# Altium schematic sheet 05_SiP_IO.SchDoc
size 812 x 508 mm; SheetNumber: 5; SheetTotal: 16
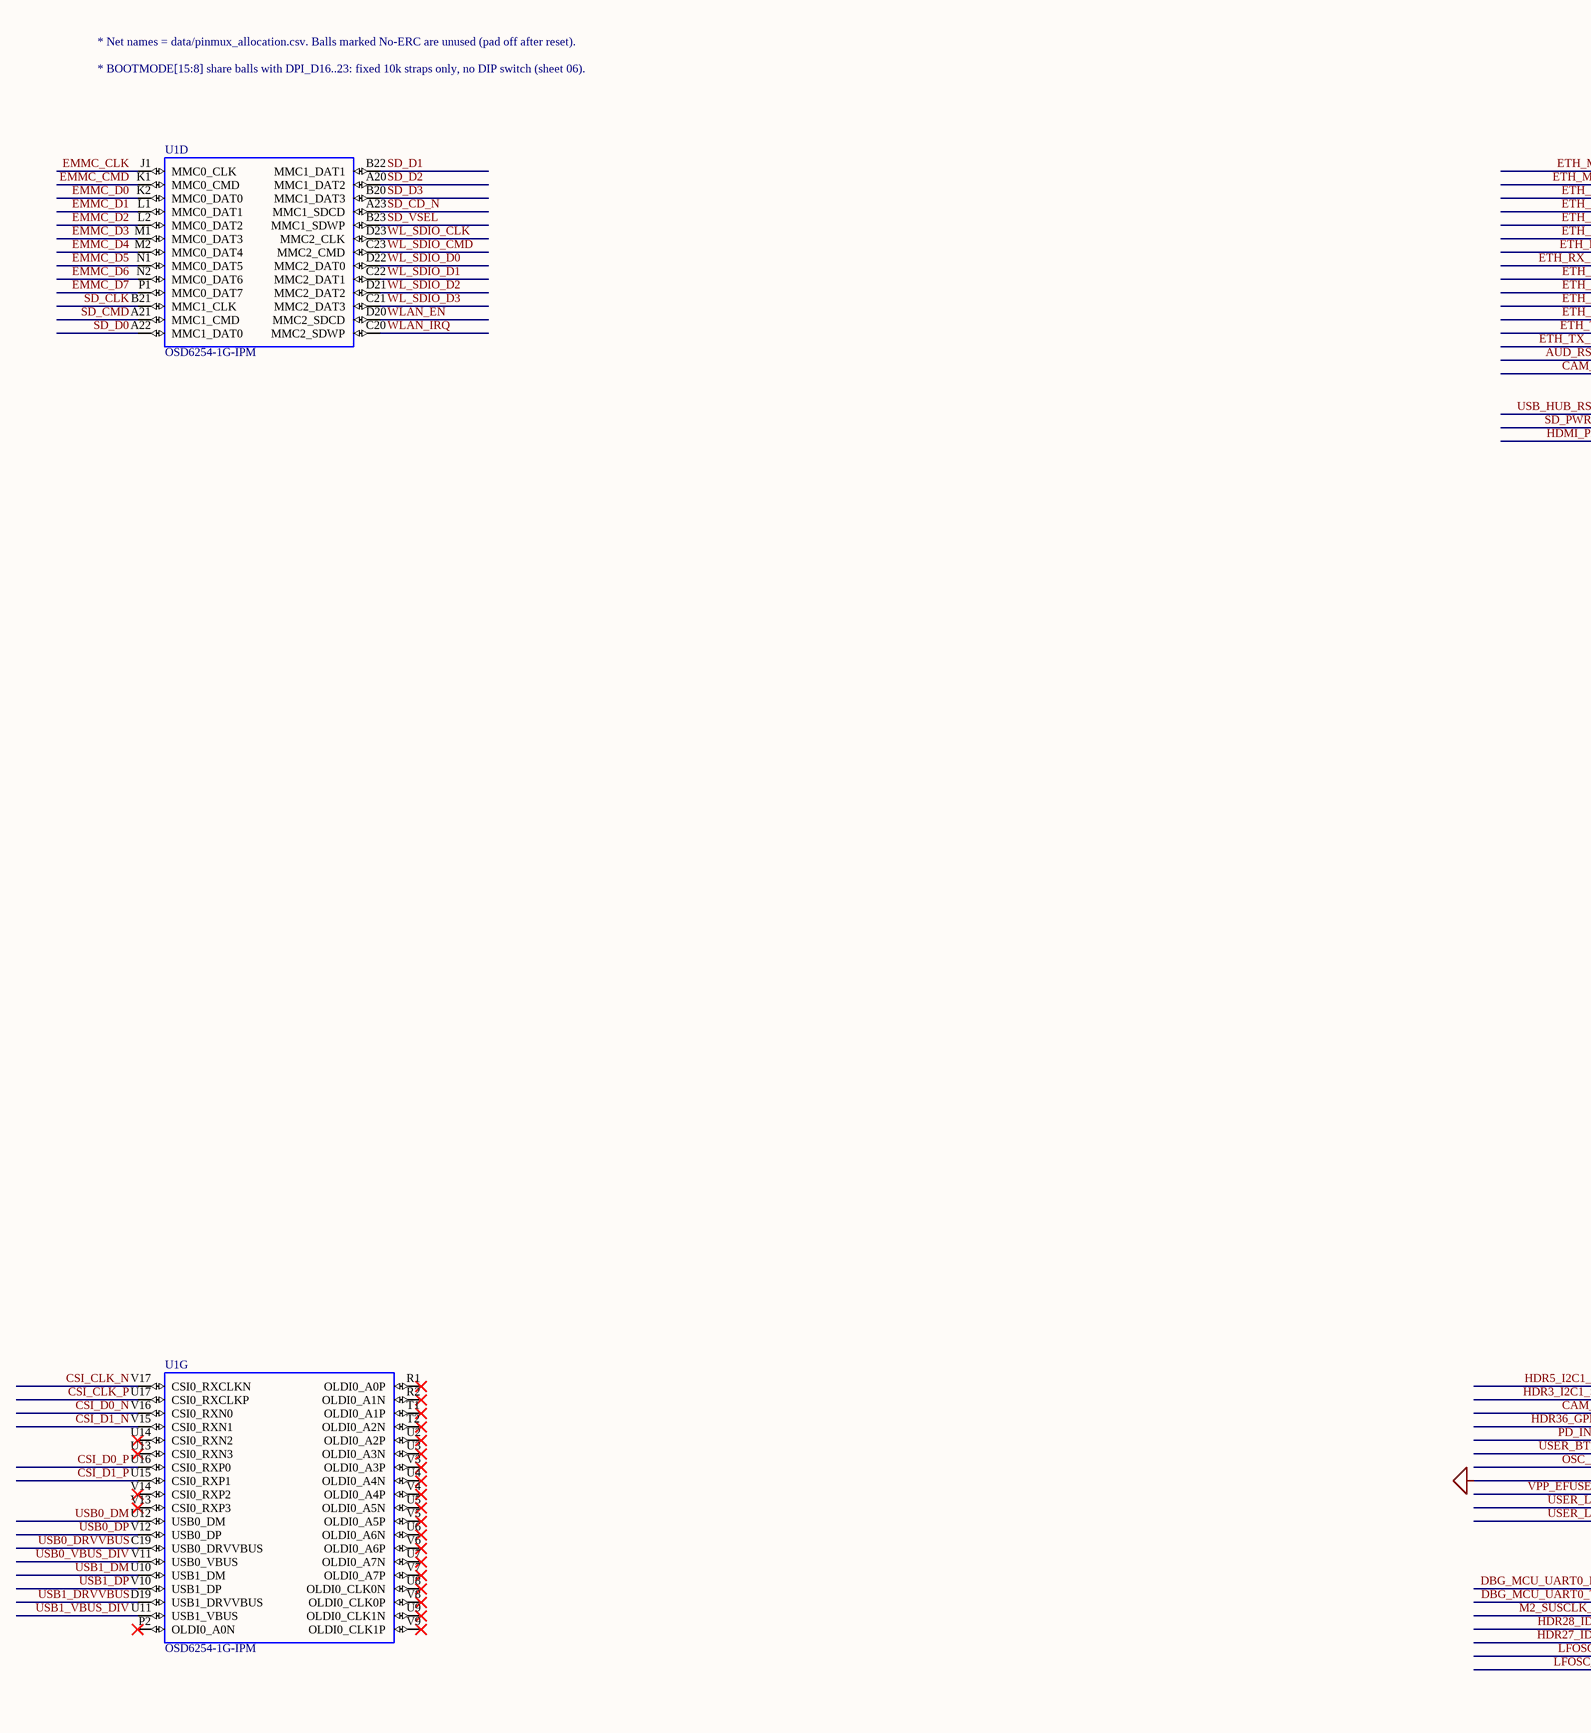
[diagram p0: 05_SiP_IO.SchDoc, left]
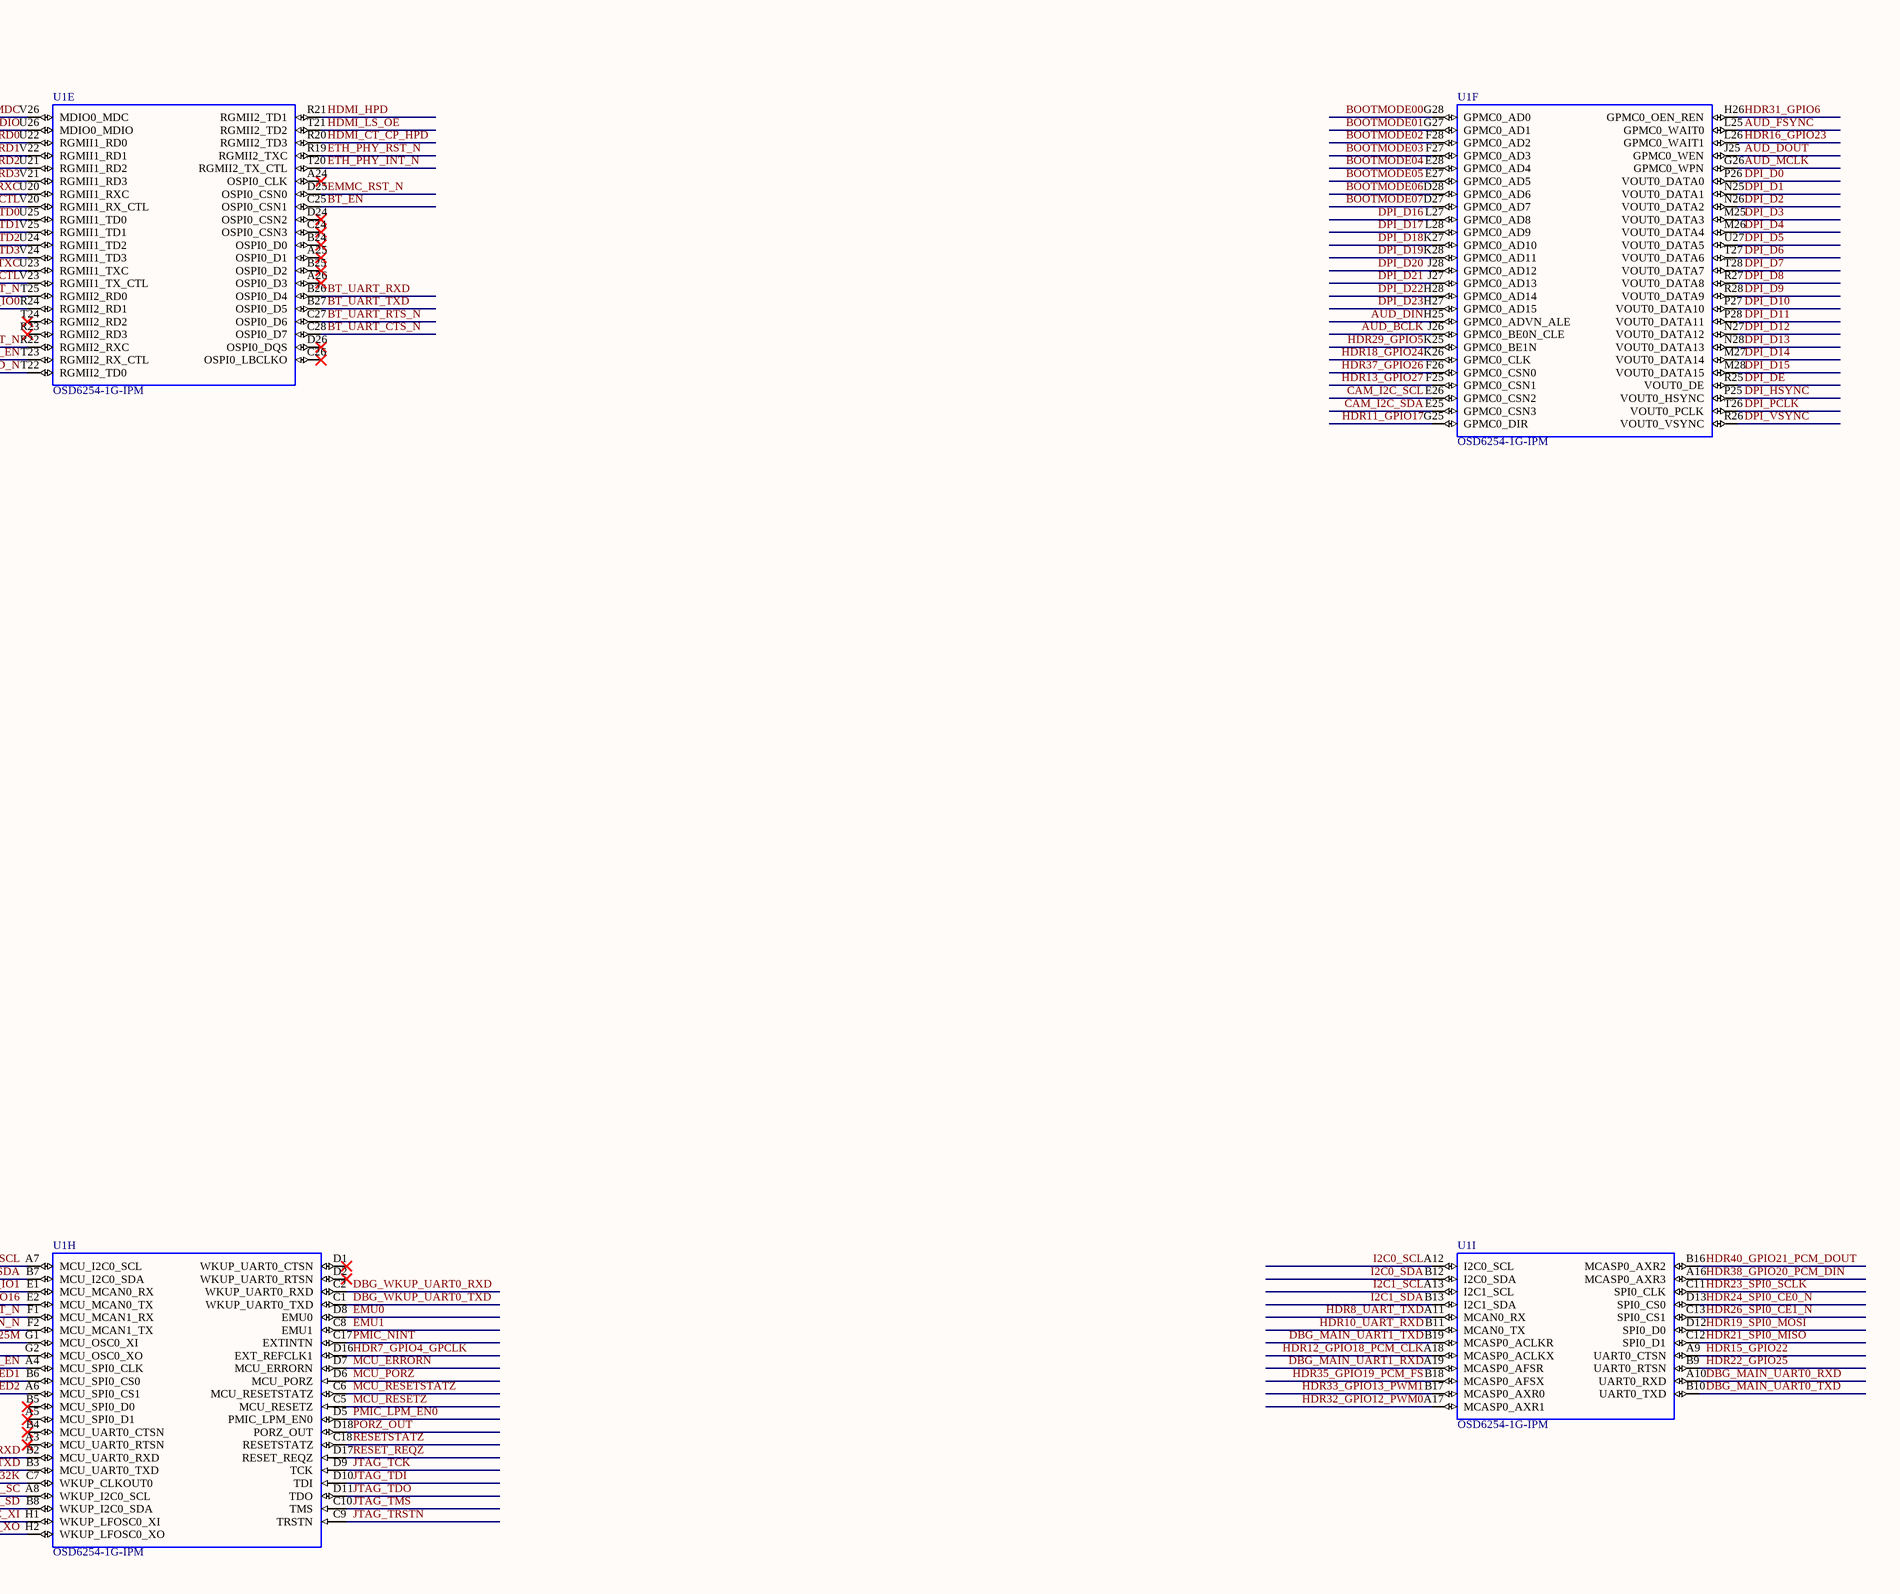
[diagram p1: 05_SiP_IO.SchDoc, right]

## Parts
U1  OSD6254-1G-IPM  [OSD62X-PM_BGA500]  (parts D,E,F,G,H,I of 9)

## Nets
GND: U1.G2(MCU_OSC0_XO)
AUD_BCLK: U1.J26(GPMC0_BE0N_CLE)
AUD_DIN: U1.H25(GPMC0_ADVN_ALE)
AUD_DOUT: U1.J25(GPMC0_WEN)
AUD_FSYNC: U1.L25(GPMC0_WAIT0)
AUD_MCLK: U1.G26(GPMC0_WPN)
AUD_RST_N: U1.T25(RGMII2_RD0)
BOOTMODE00: U1.G28(GPMC0_AD0)
BOOTMODE01: U1.G27(GPMC0_AD1)
BOOTMODE02: U1.F28(GPMC0_AD2)
BOOTMODE03: U1.F27(GPMC0_AD3)
BOOTMODE04: U1.E28(GPMC0_AD4)
BOOTMODE05: U1.E27(GPMC0_AD5)
BOOTMODE06: U1.D28(GPMC0_AD6)
BOOTMODE07: U1.D27(GPMC0_AD7)
BT_EN: U1.C25(OSPI0_CSN1)
BT_UART_CTS_N: U1.C28(OSPI0_D7)
BT_UART_RTS_N: U1.C27(OSPI0_D6)
BT_UART_RXD: U1.B26(OSPI0_D4)
BT_UART_TXD: U1.B27(OSPI0_D5)
CAM_I2C_SCL: U1.E26(GPMC0_CSN2)
CAM_I2C_SDA: U1.E25(GPMC0_CSN3)
CAM_IO0: U1.R24(RGMII2_RD1)
CAM_IO1: U1.E1(MCU_MCAN0_RX)
CSI_CLK_N: U1.V17(CSI0_RXCLKN)
CSI_CLK_P: U1.U17(CSI0_RXCLKP)
CSI_D0_N: U1.V16(CSI0_RXN0)
CSI_D0_P: U1.U16(CSI0_RXP0)
CSI_D1_N: U1.V15(CSI0_RXN1)
CSI_D1_P: U1.U15(CSI0_RXP1)
DBG_MAIN_UART0_RXD: U1.A10(UART0_RXD)
DBG_MAIN_UART0_TXD: U1.B10(UART0_TXD)
DBG_MAIN_UART1_RXD: U1.A19(MCASP0_AFSR)
DBG_MAIN_UART1_TXD: U1.B19(MCASP0_ACLKR)
DBG_MCU_UART0_RXD: U1.B2(MCU_UART0_RXD)
DBG_MCU_UART0_TXD: U1.B3(MCU_UART0_TXD)
DBG_WKUP_UART0_RXD: U1.C2(WKUP_UART0_RXD)
DBG_WKUP_UART0_TXD: U1.C1(WKUP_UART0_TXD)
DPI_D0: U1.P26(VOUT0_DATA0)
DPI_D1: U1.N25(VOUT0_DATA1)
DPI_D2: U1.N26(VOUT0_DATA2)
DPI_D3: U1.M25(VOUT0_DATA3)
DPI_D4: U1.M26(VOUT0_DATA4)
DPI_D5: U1.U27(VOUT0_DATA5)
DPI_D6: U1.T27(VOUT0_DATA6)
DPI_D7: U1.T28(VOUT0_DATA7)
DPI_D8: U1.R27(VOUT0_DATA8)
DPI_D9: U1.R28(VOUT0_DATA9)
DPI_D10: U1.P27(VOUT0_DATA10)
DPI_D11: U1.P28(VOUT0_DATA11)
DPI_D12: U1.N27(VOUT0_DATA12)
DPI_D13: U1.N28(VOUT0_DATA13)
DPI_D14: U1.M27(VOUT0_DATA14)
DPI_D15: U1.M28(VOUT0_DATA15)
DPI_D16: U1.L27(GPMC0_AD8)
DPI_D17: U1.L28(GPMC0_AD9)
DPI_D18: U1.K27(GPMC0_AD10)
DPI_D19: U1.K28(GPMC0_AD11)
DPI_D20: U1.J28(GPMC0_AD12)
DPI_D21: U1.J27(GPMC0_AD13)
DPI_D22: U1.H28(GPMC0_AD14)
DPI_D23: U1.H27(GPMC0_AD15)
DPI_DE: U1.R25(VOUT0_DE)
DPI_HSYNC: U1.P25(VOUT0_HSYNC)
DPI_PCLK: U1.T26(VOUT0_PCLK)
DPI_VSYNC: U1.R26(VOUT0_VSYNC)
EMMC_CLK: U1.J1(MMC0_CLK)
EMMC_CMD: U1.K1(MMC0_CMD)
EMMC_D0: U1.K2(MMC0_DAT0)
EMMC_D1: U1.L1(MMC0_DAT1)
EMMC_D2: U1.L2(MMC0_DAT2)
EMMC_D3: U1.M1(MMC0_DAT3)
EMMC_D4: U1.M2(MMC0_DAT4)
EMMC_D5: U1.N1(MMC0_DAT5)
EMMC_D6: U1.N2(MMC0_DAT6)
EMMC_D7: U1.P1(MMC0_DAT7)
EMMC_RST_N: U1.D25(OSPI0_CSN0)
EMU0: U1.D8(EMU0)
EMU1: U1.C8(EMU1)
ETH_MDC: U1.V26(MDIO0_MDC)
ETH_MDIO: U1.U26(MDIO0_MDIO)
ETH_PHY_INT_N: U1.T20(RGMII2_TX_CTL)
ETH_PHY_RST_N: U1.R19(RGMII2_TXC)
ETH_RD0: U1.U22(RGMII1_RD0)
ETH_RD1: U1.V22(RGMII1_RD1)
ETH_RD2: U1.U21(RGMII1_RD2)
ETH_RD3: U1.V21(RGMII1_RD3)
ETH_RX_CTL: U1.V20(RGMII1_RX_CTL)
ETH_RXC: U1.U20(RGMII1_RXC)
ETH_TD0: U1.U25(RGMII1_TD0)
ETH_TD1: U1.V25(RGMII1_TD1)
ETH_TD2: U1.U24(RGMII1_TD2)
ETH_TD3: U1.V24(RGMII1_TD3)
ETH_TX_CTL: U1.V23(RGMII1_TX_CTL)
ETH_TXC: U1.U23(RGMII1_TXC)
HDMI_CT_CP_HPD: U1.R20(RGMII2_TD3)
HDMI_HPD: U1.R21(RGMII2_TD1)
HDMI_LS_OE: U1.T21(RGMII2_TD2)
HDMI_PD_N: U1.T22(RGMII2_TD0)
HDR3_I2C1_SDA: U1.B7(MCU_I2C0_SDA)
HDR5_I2C1_SCL: U1.A7(MCU_I2C0_SCL)
HDR7_GPIO4_GPCLK: U1.D16(EXT_REFCLK1)
HDR8_UART_TXD: U1.A11(MCAN0_RX)
HDR10_UART_RXD: U1.B11(MCAN0_TX)
HDR11_GPIO17: U1.G25(GPMC0_DIR)
HDR12_GPIO18_PCM_CLK: U1.A18(MCASP0_ACLKX)
HDR13_GPIO27: U1.F25(GPMC0_CSN1)
HDR15_GPIO22: U1.A9(UART0_CTSN)
HDR16_GPIO23: U1.L26(GPMC0_WAIT1)
HDR18_GPIO24: U1.K26(GPMC0_CLK)
HDR19_SPI0_MOSI: U1.D12(SPI0_D0)
HDR21_SPI0_MISO: U1.C12(SPI0_D1)
HDR22_GPIO25: U1.B9(UART0_RTSN)
HDR23_SPI0_SCLK: U1.C11(SPI0_CLK)
HDR24_SPI0_CE0_N: U1.D13(SPI0_CS0)
HDR26_SPI0_CE1_N: U1.C13(SPI0_CS1)
HDR27_ID_SD: U1.B8(WKUP_I2C0_SDA)
HDR28_ID_SC: U1.A8(WKUP_I2C0_SCL)
HDR29_GPIO5: U1.K25(GPMC0_BE1N)
HDR31_GPIO6: U1.H26(GPMC0_OEN_REN)
HDR32_GPIO12_PWM0: U1.A17(MCASP0_AXR1)
HDR33_GPIO13_PWM1: U1.B17(MCASP0_AXR0)
HDR35_GPIO19_PCM_FS: U1.B18(MCASP0_AFSX)
HDR36_GPIO16: U1.E2(MCU_MCAN0_TX)
HDR37_GPIO26: U1.F26(GPMC0_CSN0)
HDR38_GPIO20_PCM_DIN: U1.A16(MCASP0_AXR3)
HDR40_GPIO21_PCM_DOUT: U1.B16(MCASP0_AXR2)
I2C0_SCL: U1.A12(I2C0_SCL)
I2C0_SDA: U1.B12(I2C0_SDA)
I2C1_SCL: U1.A13(I2C1_SCL)
I2C1_SDA: U1.B13(I2C1_SDA)
JTAG_TCK: U1.D9(TCK)
JTAG_TDI: U1.D10(TDI)
JTAG_TDO: U1.D11(TDO)
JTAG_TMS: U1.C10(TMS)
JTAG_TRSTN: U1.C9(TRSTN)
LFOSC_XI: U1.H1(WKUP_LFOSC0_XI)
LFOSC_XO: U1.H2(WKUP_LFOSC0_XO)
M2_SUSCLK_32K: U1.C7(WKUP_CLKOUT0)
MCU_ERRORN: U1.D7(MCU_ERRORN)
MCU_PORZ: U1.D6(MCU_PORZ)
MCU_RESETSTATZ: U1.C6(MCU_RESETSTATZ)
MCU_RESETZ: U1.C5(MCU_RESETZ)
OSC_25M: U1.G1(MCU_OSC0_XI)
PD_INT_N: U1.F1(MCU_MCAN1_RX)
PMIC_LPM_EN0: U1.D5(PMIC_LPM_EN0)
PMIC_NINT: U1.C17(EXTINTN)
PORZ_OUT: U1.D18(PORZ_OUT)
RESET_REQZ: U1.D17(RESET_REQZ)
RESETSTATZ: U1.C18(RESETSTATZ)
SD_CD_N: U1.A23(MMC1_SDCD)
SD_CLK: U1.B21(MMC1_CLK)
SD_CMD: U1.A21(MMC1_CMD)
SD_D0: U1.A22(MMC1_DAT0)
SD_D1: U1.B22(MMC1_DAT1)
SD_D2: U1.A20(MMC1_DAT2)
SD_D3: U1.B20(MMC1_DAT3)
SD_PWR_EN: U1.T23(RGMII2_RX_CTL)
SD_VSEL: U1.B23(MMC1_SDWP)
USB0_DM: U1.U12(USB0_DM)
USB0_DP: U1.V12(USB0_DP)
USB0_DRVVBUS: U1.C19(USB0_DRVVBUS)
USB0_VBUS_DIV: U1.V11(USB0_VBUS)
USB1_DM: U1.U10(USB1_DM)
USB1_DP: U1.V10(USB1_DP)
USB1_DRVVBUS: U1.D19(USB1_DRVVBUS)
USB1_VBUS_DIV: U1.U11(USB1_VBUS)
USB_HUB_RST_N: U1.R22(RGMII2_RXC)
USER_BTN_N: U1.F2(MCU_MCAN1_TX)
USER_LED1: U1.B6(MCU_SPI0_CS0)
USER_LED2: U1.A6(MCU_SPI0_CS1)
VPP_EFUSE_EN: U1.A4(MCU_SPI0_CLK)
WL_SDIO_CLK: U1.D23(MMC2_CLK)
WL_SDIO_CMD: U1.C23(MMC2_CMD)
WL_SDIO_D0: U1.D22(MMC2_DAT0)
WL_SDIO_D1: U1.C22(MMC2_DAT1)
WL_SDIO_D2: U1.D21(MMC2_DAT2)
WL_SDIO_D3: U1.C21(MMC2_DAT3)
WLAN_EN: U1.D20(MMC2_SDCD)
WLAN_IRQ: U1.C20(MMC2_SDWP)

Not connected (* = marked no-connect by the designer): U1 A3(MCU_UART0_RTSN)* A5(MCU_SPI0_D1)* A24(OSPI0_CLK)* A25(OSPI0_D1)* A26(OSPI0_D3)* B4(MCU_UART0_CTSN)* B5(MCU_SPI0_D0)* B24(OSPI0_D0)* B25(OSPI0_D2)* C24(OSPI0_CSN3)* C26(OSPI0_LBCLKO)* D1(WKUP_UART0_CTSN)* D2(WKUP_UART0_RTSN)* D24(OSPI0_CSN2)* D26(OSPI0_DQS)* P2(OLDI0_A0N)* R1(OLDI0_A0P)* R2(OLDI0_A1N)* R23(RGMII2_RD3)* T1(OLDI0_A1P)* T2(OLDI0_A2N)* T24(RGMII2_RD2)* U2(OLDI0_A2P)* U3(OLDI0_A3N)* U4(OLDI0_A4N)* U5(OLDI0_A5N)* U6(OLDI0_A6N)* U7(OLDI0_A7N)* U8(OLDI0_CLK0N)* U9(OLDI0_CLK1N)* U13(CSI0_RXN3)* U14(CSI0_RXN2)* V3(OLDI0_A3P)* V4(OLDI0_A4P)* V5(OLDI0_A5P)* V6(OLDI0_A6P)* V7(OLDI0_A7P)* V8(OLDI0_CLK0P)* V9(OLDI0_CLK1P)* V13(CSI0_RXP3)* V14(CSI0_RXP2)*

## Notes on the sheet
- * Net names = data/pinmux_allocation.csv. Balls marked No-ERC are unused (pad off after reset).
- * BOOTMODE[15:8] share balls with DPI_D16..23: fixed 10k straps only, no DIP switch (sheet 06).

## Library data of the parts
U1 = OSD6254-1G-IPM: Octavo OSD6254 SiP: TI AM6254 + 1 GB DDR4, 9x14 mm 500-ball 0.5 mm BGA